# Altium schematic sheet 06_KOM_ACB23_4009_FPGA.SchDoc: FPGA
size A4; DocumentNumber: 2023-03-28; Revision: v0.11; SheetNumber: 6; SheetTotal: 9
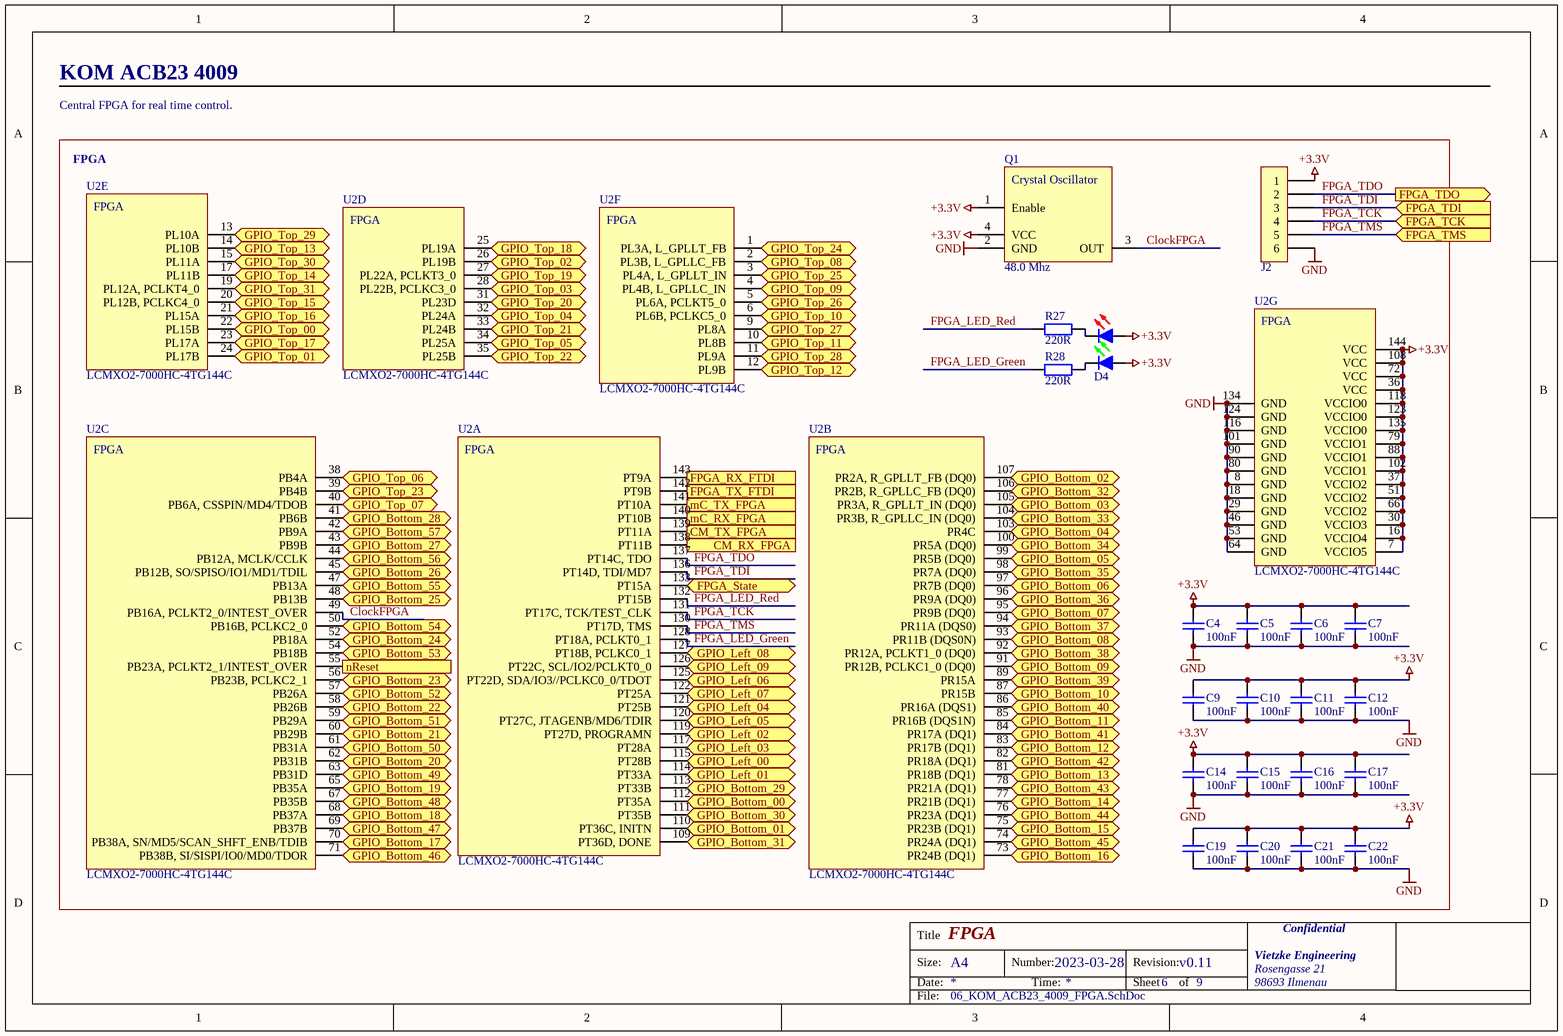
[diagram p0: 06_KOM_ACB23_4009_FPGA.SchDoc]

## Parts
C4  value 100nF  [C0402]  (hidden comment: C0402C104K3RACTU)
C5  value 100nF  [C0402]  (hidden comment: C0402C104K3RACTU)
C6  value 100nF  [C0402]  (hidden comment: C0402C104K3RACTU)
C7  value 100nF  [C0402]  (hidden comment: C0402C104K3RACTU)
C9  value 100nF  [C0402]  (hidden comment: C0402C104K3RACTU)
C10  value 100nF  [C0402]  (hidden comment: C0402C104K3RACTU)
C11  value 100nF  [C0402]  (hidden comment: C0402C104K3RACTU)
C12  value 100nF  [C0402]  (hidden comment: C0402C104K3RACTU)
C14  value 100nF  [C0402]  (hidden comment: C0402C104K3RACTU)
C15  value 100nF  [C0402]  (hidden comment: C0402C104K3RACTU)
C16  value 100nF  [C0402]  (hidden comment: C0402C104K3RACTU)
C17  value 100nF  [C0402]  (hidden comment: C0402C104K3RACTU)
C19  value 100nF  [C0402]  (hidden comment: C0402C104K3RACTU)
C20  value 100nF  [C0402]  (hidden comment: C0402C104K3RACTU)
C21  value 100nF  [C0402]  (hidden comment: C0402C104K3RACTU)
C22  value 100nF  [C0402]  (hidden comment: C0402C104K3RACTU)
D4  LTST-C195KGJRKT  [SMD LED 0606 DUAL GREEN RED]  (value not drawn)
J2  53047-0610  [PicoBlade 01x06 THT Male]  (value not drawn)
Q1  value 48.0 Mhz  [Crystal_3.2x2.5]  (hidden comment: ECS-3225MV-480-CN-TR)
R27  value 220R  [R0402]  (hidden comment: RC0402FR-07220RL)
R28  value 220R  [R0402]  (hidden comment: RC0402FR-07220RL)
U2  LCMXO2-7000HC-4TG144C  [TQFP-144_20x20_P0.5]  (parts A,B,C,D,E,F,G of 7)

## Blocks framed on the sheet
FPGA: C4-C7 C9-C12 C14-C17 C19-C22 D4 J2 Q1 R27 R28 U2

## Ports
CM_RX_FPGA (out), CM_TX_FPGA (in), FPGA_RX_FTDI (in), FPGA_State (bidir), FPGA_TCK (in), FPGA_TDI (in), FPGA_TDO (out), FPGA_TMS (in), FPGA_TX_FTDI (out), GPIO_Bottom_00 (bidir), GPIO_Bottom_01 (bidir), GPIO_Bottom_02 (bidir), GPIO_Bottom_03 (bidir), GPIO_Bottom_04 (bidir), GPIO_Bottom_05 (bidir), GPIO_Bottom_06 (bidir), GPIO_Bottom_07 (bidir), GPIO_Bottom_08 (bidir), GPIO_Bottom_09 (bidir), GPIO_Bottom_10 (bidir), GPIO_Bottom_11 (bidir), GPIO_Bottom_12 (bidir), GPIO_Bottom_13 (bidir), GPIO_Bottom_14 (bidir), GPIO_Bottom_15 (bidir), GPIO_Bottom_16 (bidir), GPIO_Bottom_17 (bidir), GPIO_Bottom_18 (bidir), GPIO_Bottom_19 (bidir), GPIO_Bottom_20 (bidir), GPIO_Bottom_21 (bidir), GPIO_Bottom_22 (bidir), GPIO_Bottom_23 (bidir), GPIO_Bottom_24 (bidir), GPIO_Bottom_25 (bidir), GPIO_Bottom_26 (bidir), GPIO_Bottom_27 (bidir), GPIO_Bottom_28 (bidir), GPIO_Bottom_29 (bidir), GPIO_Bottom_30 (bidir), GPIO_Bottom_31 (bidir), GPIO_Bottom_32 (bidir), GPIO_Bottom_33 (bidir), GPIO_Bottom_34 (bidir), GPIO_Bottom_35 (bidir), GPIO_Bottom_36 (bidir), GPIO_Bottom_37 (bidir), GPIO_Bottom_38 (bidir), GPIO_Bottom_39 (bidir), GPIO_Bottom_40 (bidir), GPIO_Bottom_41 (bidir), GPIO_Bottom_42 (bidir), GPIO_Bottom_43 (bidir), GPIO_Bottom_44 (bidir), GPIO_Bottom_45 (bidir), GPIO_Bottom_46 (bidir), GPIO_Bottom_47 (bidir), GPIO_Bottom_48 (bidir), GPIO_Bottom_49 (bidir), GPIO_Bottom_50 (bidir), GPIO_Bottom_51 (bidir), GPIO_Bottom_52 (bidir), GPIO_Bottom_53 (bidir), GPIO_Bottom_54 (bidir), GPIO_Bottom_55 (bidir), GPIO_Bottom_56 (bidir), GPIO_Bottom_57 (bidir), GPIO_Left_00 (bidir), GPIO_Left_01 (bidir), GPIO_Left_02 (bidir), GPIO_Left_03 (bidir), GPIO_Left_04 (bidir), GPIO_Left_05 (bidir), GPIO_Left_06 (bidir), GPIO_Left_07 (bidir), GPIO_Left_08 (bidir), GPIO_Left_09 (bidir), GPIO_Top_00 (bidir), GPIO_Top_01 (bidir), GPIO_Top_02 (bidir), GPIO_Top_03 (bidir), GPIO_Top_04 (bidir), GPIO_Top_05 (bidir), GPIO_Top_06 (bidir), GPIO_Top_07 (bidir), GPIO_Top_08 (bidir), GPIO_Top_09 (bidir), GPIO_Top_10 (bidir), GPIO_Top_11 (bidir), GPIO_Top_12 (bidir), GPIO_Top_13 (bidir), GPIO_Top_14 (bidir), GPIO_Top_15 (bidir), GPIO_Top_16 (bidir), GPIO_Top_17 (bidir), GPIO_Top_18 (bidir), GPIO_Top_19 (bidir), GPIO_Top_20 (bidir), GPIO_Top_21 (bidir), GPIO_Top_22 (bidir), GPIO_Top_23 (bidir), GPIO_Top_24 (bidir), GPIO_Top_25 (bidir), GPIO_Top_26 (bidir), GPIO_Top_27 (bidir), GPIO_Top_28 (bidir), GPIO_Top_29 (bidir), GPIO_Top_30 (bidir), GPIO_Top_31 (bidir), mC_RX_FPGA (out), mC_TX_FPGA (in), nReset (in)

## Nets
+3.3V: C4.2 C5.2 C6.2 C7.2 C9.2 C10.2 C11.2 C12.2 C14.2 C15.2 C16.2 C17.2 C19.2 C20.2 C21.2 C22.2 D4.1(AG) D4.2(AR) J2.1 Q1.1(Enable) Q1.4(VCC) U2.7(VCCIO5) U2.16(VCCIO4) U2.30(VCCIO3) U2.36(VCC) U2.37(VCCIO2) U2.51(VCCIO2) U2.66(VCCIO2) U2.72(VCC) U2.79(VCCIO1) U2.88(VCCIO1) U2.102(VCCIO1) U2.108(VCC) U2.118(VCCIO0) U2.123(VCCIO0) U2.135(VCCIO0) U2.144(VCC)
GND: C4.1 C5.1 C6.1 C7.1 C9.1 C10.1 C11.1 C12.1 C14.1 C15.1 C16.1 C17.1 C19.1 C20.1 C21.1 C22.1 J2.6 Q1.2(GND) U2.8(GND) U2.18(GND) U2.29(GND) U2.46(GND) U2.53(GND) U2.64(GND) U2.80(GND) U2.90(GND) U2.101(GND) U2.116(GND) U2.124(GND) U2.134(GND)
ClockFPGA: Q1.3(OUT) U2.49(PB16A,_PCLKT2_0/INTEST_OVER)
CM_RX_FPGA: U2.138(PT11B) ; port CM_RX_FPGA
CM_TX_FPGA: U2.139(PT11A) ; port CM_TX_FPGA
FPGA_LED_Green: R28.1 U2.128(PT18A,_PCLKT0_1)
FPGA_LED_Red: R27.1 U2.132(PT15B)
FPGA_RX_FTDI: U2.143(PT9A) ; port FPGA_RX_FTDI
FPGA_State: U2.133(PT15A) ; port FPGA_State
FPGA_TCK: J2.4 U2.131(PT17C,_TCK/TEST_CLK) ; port FPGA_TCK
FPGA_TDI: J2.3 U2.136(PT14D,_TDI/MD7) ; port FPGA_TDI
FPGA_TDO: J2.2 U2.137(PT14C,_TDO) ; port FPGA_TDO
FPGA_TMS: J2.5 U2.130(PT17D,_TMS) ; port FPGA_TMS
FPGA_TX_FTDI: U2.142(PT9B) ; port FPGA_TX_FTDI
GPIO_Bottom_00: U2.112(PT35A) ; port GPIO_Bottom_00
GPIO_Bottom_01: U2.110(PT36C,_INITN) ; port GPIO_Bottom_01
GPIO_Bottom_02: U2.107(PR2A,_R_GPLLT_FB_(DQ0)) ; port GPIO_Bottom_02
GPIO_Bottom_03: U2.105(PR3A,_R_GPLLT_IN_(DQ0)) ; port GPIO_Bottom_03
GPIO_Bottom_04: U2.103(PR4C) ; port GPIO_Bottom_04
GPIO_Bottom_05: U2.99(PR5B_(DQ0)) ; port GPIO_Bottom_05
GPIO_Bottom_06: U2.97(PR7B_(DQ0)) ; port GPIO_Bottom_06
GPIO_Bottom_07: U2.95(PR9B_(DQ0)) ; port GPIO_Bottom_07
GPIO_Bottom_08: U2.93(PR11B_(DQS0N)) ; port GPIO_Bottom_08
GPIO_Bottom_09: U2.91(PR12B,_PCLKC1_0_(DQ0)) ; port GPIO_Bottom_09
GPIO_Bottom_10: U2.87(PR15B) ; port GPIO_Bottom_10
GPIO_Bottom_11: U2.85(PR16B_(DQS1N)) ; port GPIO_Bottom_11
GPIO_Bottom_12: U2.83(PR17B_(DQ1)) ; port GPIO_Bottom_12
GPIO_Bottom_13: U2.81(PR18B_(DQ1)) ; port GPIO_Bottom_13
GPIO_Bottom_14: U2.77(PR21B_(DQ1)) ; port GPIO_Bottom_14
GPIO_Bottom_15: U2.75(PR23B_(DQ1)) ; port GPIO_Bottom_15
GPIO_Bottom_16: U2.73(PR24B_(DQ1)) ; port GPIO_Bottom_16
GPIO_Bottom_17: U2.70(PB38A,_SN/MD5/SCAN_SHFT_ENB/TDIB) ; port GPIO_Bottom_17
GPIO_Bottom_18: U2.68(PB37A) ; port GPIO_Bottom_18
GPIO_Bottom_19: U2.65(PB35A) ; port GPIO_Bottom_19
GPIO_Bottom_20: U2.62(PB31B) ; port GPIO_Bottom_20
GPIO_Bottom_21: U2.60(PB29B) ; port GPIO_Bottom_21
GPIO_Bottom_22: U2.58(PB26B) ; port GPIO_Bottom_22
GPIO_Bottom_23: U2.56(PB23B,_PCLKC2_1) ; port GPIO_Bottom_23
GPIO_Bottom_24: U2.52(PB18A) ; port GPIO_Bottom_24
GPIO_Bottom_25: U2.48(PB13B) ; port GPIO_Bottom_25
GPIO_Bottom_26: U2.45(PB12B,_SO/SPISO/IO1/MD1/TDIL) ; port GPIO_Bottom_26
GPIO_Bottom_27: U2.43(PB9B) ; port GPIO_Bottom_27
GPIO_Bottom_28: U2.41(PB6B) ; port GPIO_Bottom_28
GPIO_Bottom_29: U2.113(PT33B) ; port GPIO_Bottom_29
GPIO_Bottom_30: U2.111(PT35B) ; port GPIO_Bottom_30
GPIO_Bottom_31: U2.109(PT36D,_DONE) ; port GPIO_Bottom_31
GPIO_Bottom_32: U2.106(PR2B,_R_GPLLC_FB_(DQ0)) ; port GPIO_Bottom_32
GPIO_Bottom_33: U2.104(PR3B,_R_GPLLC_IN_(DQ0)) ; port GPIO_Bottom_33
GPIO_Bottom_34: U2.100(PR5A_(DQ0)) ; port GPIO_Bottom_34
GPIO_Bottom_35: U2.98(PR7A_(DQ0)) ; port GPIO_Bottom_35
GPIO_Bottom_36: U2.96(PR9A_(DQ0)) ; port GPIO_Bottom_36
GPIO_Bottom_37: U2.94(PR11A_(DQS0)) ; port GPIO_Bottom_37
GPIO_Bottom_38: U2.92(PR12A,_PCLKT1_0_(DQ0)) ; port GPIO_Bottom_38
GPIO_Bottom_39: U2.89(PR15A) ; port GPIO_Bottom_39
GPIO_Bottom_40: U2.86(PR16A_(DQS1)) ; port GPIO_Bottom_40
GPIO_Bottom_41: U2.84(PR17A_(DQ1)) ; port GPIO_Bottom_41
GPIO_Bottom_42: U2.82(PR18A_(DQ1)) ; port GPIO_Bottom_42
GPIO_Bottom_43: U2.78(PR21A_(DQ1)) ; port GPIO_Bottom_43
GPIO_Bottom_44: U2.76(PR23A_(DQ1)) ; port GPIO_Bottom_44
GPIO_Bottom_45: U2.74(PR24A_(DQ1)) ; port GPIO_Bottom_45
GPIO_Bottom_46: U2.71(PB38B,_SI/SISPI/IO0/MD0/TDOR) ; port GPIO_Bottom_46
GPIO_Bottom_47: U2.69(PB37B) ; port GPIO_Bottom_47
GPIO_Bottom_48: U2.67(PB35B) ; port GPIO_Bottom_48
GPIO_Bottom_49: U2.63(PB31D) ; port GPIO_Bottom_49
GPIO_Bottom_50: U2.61(PB31A) ; port GPIO_Bottom_50
GPIO_Bottom_51: U2.59(PB29A) ; port GPIO_Bottom_51
GPIO_Bottom_52: U2.57(PB26A) ; port GPIO_Bottom_52
GPIO_Bottom_53: U2.54(PB18B) ; port GPIO_Bottom_53
GPIO_Bottom_54: U2.50(PB16B,_PCLKC2_0) ; port GPIO_Bottom_54
GPIO_Bottom_55: U2.47(PB13A) ; port GPIO_Bottom_55
GPIO_Bottom_56: U2.44(PB12A,_MCLK/CCLK) ; port GPIO_Bottom_56
GPIO_Bottom_57: U2.42(PB9A) ; port GPIO_Bottom_57
GPIO_Left_00: U2.115(PT28B) ; port GPIO_Left_00
GPIO_Left_01: U2.114(PT33A) ; port GPIO_Left_01
GPIO_Left_02: U2.119(PT27D,_PROGRAMN) ; port GPIO_Left_02
GPIO_Left_03: U2.117(PT28A) ; port GPIO_Left_03
GPIO_Left_04: U2.121(PT25B) ; port GPIO_Left_04
GPIO_Left_05: U2.120(PT27C,_JTAGENB/MD6/TDIR) ; port GPIO_Left_05
GPIO_Left_06: U2.125(PT22D,_SDA/IO3//PCLKC0_0/TDOT) ; port GPIO_Left_06
GPIO_Left_07: U2.122(PT25A) ; port GPIO_Left_07
GPIO_Left_08: U2.127(PT18B,_PCLKC0_1) ; port GPIO_Left_08
GPIO_Left_09: U2.126(PT22C,_SCL/IO2/PCLKT0_0) ; port GPIO_Left_09
GPIO_Top_00: U2.22(PL15B) ; port GPIO_Top_00
GPIO_Top_01: U2.24(PL17B) ; port GPIO_Top_01
GPIO_Top_02: U2.26(PL19B) ; port GPIO_Top_02
GPIO_Top_03: U2.28(PL22B,_PCLKC3_0) ; port GPIO_Top_03
GPIO_Top_04: U2.32(PL24A) ; port GPIO_Top_04
GPIO_Top_05: U2.34(PL25A) ; port GPIO_Top_05
GPIO_Top_06: U2.38(PB4A) ; port GPIO_Top_06
GPIO_Top_07: U2.40(PB6A,_CSSPIN/MD4/TDOB) ; port GPIO_Top_07
GPIO_Top_08: U2.2(PL3B,_L_GPLLC_FB) ; port GPIO_Top_08
GPIO_Top_09: U2.4(PL4B,_L_GPLLC_IN) ; port GPIO_Top_09
GPIO_Top_10: U2.6(PL6B,_PCLKC5_0) ; port GPIO_Top_10
GPIO_Top_11: U2.10(PL8B) ; port GPIO_Top_11
GPIO_Top_12: U2.12(PL9B) ; port GPIO_Top_12
GPIO_Top_13: U2.14(PL10B) ; port GPIO_Top_13
GPIO_Top_14: U2.17(PL11B) ; port GPIO_Top_14
GPIO_Top_15: U2.20(PL12B,_PCLKC4_0) ; port GPIO_Top_15
GPIO_Top_16: U2.21(PL15A) ; port GPIO_Top_16
GPIO_Top_17: U2.23(PL17A) ; port GPIO_Top_17
GPIO_Top_18: U2.25(PL19A) ; port GPIO_Top_18
GPIO_Top_19: U2.27(PL22A,_PCLKT3_0) ; port GPIO_Top_19
GPIO_Top_20: U2.31(PL23D) ; port GPIO_Top_20
GPIO_Top_21: U2.33(PL24B) ; port GPIO_Top_21
GPIO_Top_22: U2.35(PL25B) ; port GPIO_Top_22
GPIO_Top_23: U2.39(PB4B) ; port GPIO_Top_23
GPIO_Top_24: U2.1(PL3A,_L_GPLLT_FB) ; port GPIO_Top_24
GPIO_Top_25: U2.3(PL4A,_L_GPLLT_IN) ; port GPIO_Top_25
GPIO_Top_26: U2.5(PL6A,_PCLKT5_0) ; port GPIO_Top_26
GPIO_Top_27: U2.9(PL8A) ; port GPIO_Top_27
GPIO_Top_28: U2.11(PL9A) ; port GPIO_Top_28
GPIO_Top_29: U2.13(PL10A) ; port GPIO_Top_29
GPIO_Top_30: U2.15(PL11A) ; port GPIO_Top_30
GPIO_Top_31: U2.19(PL12A,_PCLKT4_0) ; port GPIO_Top_31
mC_RX_FPGA: U2.140(PT10B) ; port mC_RX_FPGA
mC_TX_FPGA: U2.141(PT10A) ; port mC_TX_FPGA
nReset: U2.55(PB23A,_PCLKT2_1/INTEST_OVER) ; port nReset
NetD4_3: D4.3(KG) R28.2
NetD4_4: D4.4(KR) R27.2

## Notes on the sheet
- KOM ACB23 4009
- Central FPGA for real time control.
- Title
- Size:
- Date:
- A4
- Number:
- Time:
- Revision:
- Sheet
- of
- Vietzke Engineering
- Rosengasse 21
- 98693 Ilmenau
- Confidential
- File:
- (in symbol ECS-3225MV-480-CN-TR) Crystal Oscillator
- (in symbol LCMXO2-7000HC-4TG144C, part A) FPGA
- (in symbol LCMXO2-7000HC-4TG144C, part B) FPGA
- (in symbol LCMXO2-7000HC-4TG144C, part C) FPGA
- (in symbol LCMXO2-7000HC-4TG144C, part D) FPGA
- (in symbol LCMXO2-7000HC-4TG144C, part E) FPGA
- (in symbol LCMXO2-7000HC-4TG144C, part F) FPGA
- (in symbol LCMXO2-7000HC-4TG144C, part G) FPGA

## Library data of the parts
C4-C7 C9-C12 C14-C17 C19-C22 = C0402C104K3RACTU: 0402 100nF 25.0V; Type: SMD; Package: 0402; Supplier 1: Mouser; Supplier Part Number 1: 80-C0402C104K3R
D4 = LTST-C195KGJRKT: SMD LED 0606 Dual RED GREEN; Type: SMD; Package: 0603; Supplier 1: Mouser; Supplier Part Number 1: 859-LTST-C195KGJRKT
J2 = 53047-0610: PicoBlade 01x06 Male THT; Type: THT; Package: -; Supplier 1: Mouser; Supplier Part Number 1: 538-53047-0610
Q1 = ECS-3225MV-480-CN-TR: Oscillator 48 Mhz 3.2 x 2.5; Type: SMD; Package: 3.2x2.5; Supplier 1: Mouser; Supplier Part Number 1: 520-3225MV-480-CNT
R27 R28 = RC0402FR-07220RL: 0402 220R; Type: SMD; Package: 0402; Supplier 1: Mouser; Supplier Part Number 1: 603-RC0402FR-07220RL
U2 = LCMXO2-7000HC-4TG144C: MachXO2 High Performance; 7000 LUTs; 3.3V; Type: SMD; Package: TQFP-144; Supplier 1: Mouser; Supplier Part Number 1: 842-27000HC4TG144C